# EasyEDA Pro project ProPrj_STC51_core.epro

# Schematic 51单片机核心板原理图
Assembly Variant: Basic; Board Name: Board1; Create Date: 2026-08-13; Page Name: P1; Project Name: STC51单片机核心板; Schematic Name: Schematic1; Update Date: 2026-08-13; Company: 山东科技大学信息工程2022级1班; Drawed: 姜运盛; Page Size: A4; Part Number: 内部图纸; Reviewed: 姜运盛; Version: V3.1
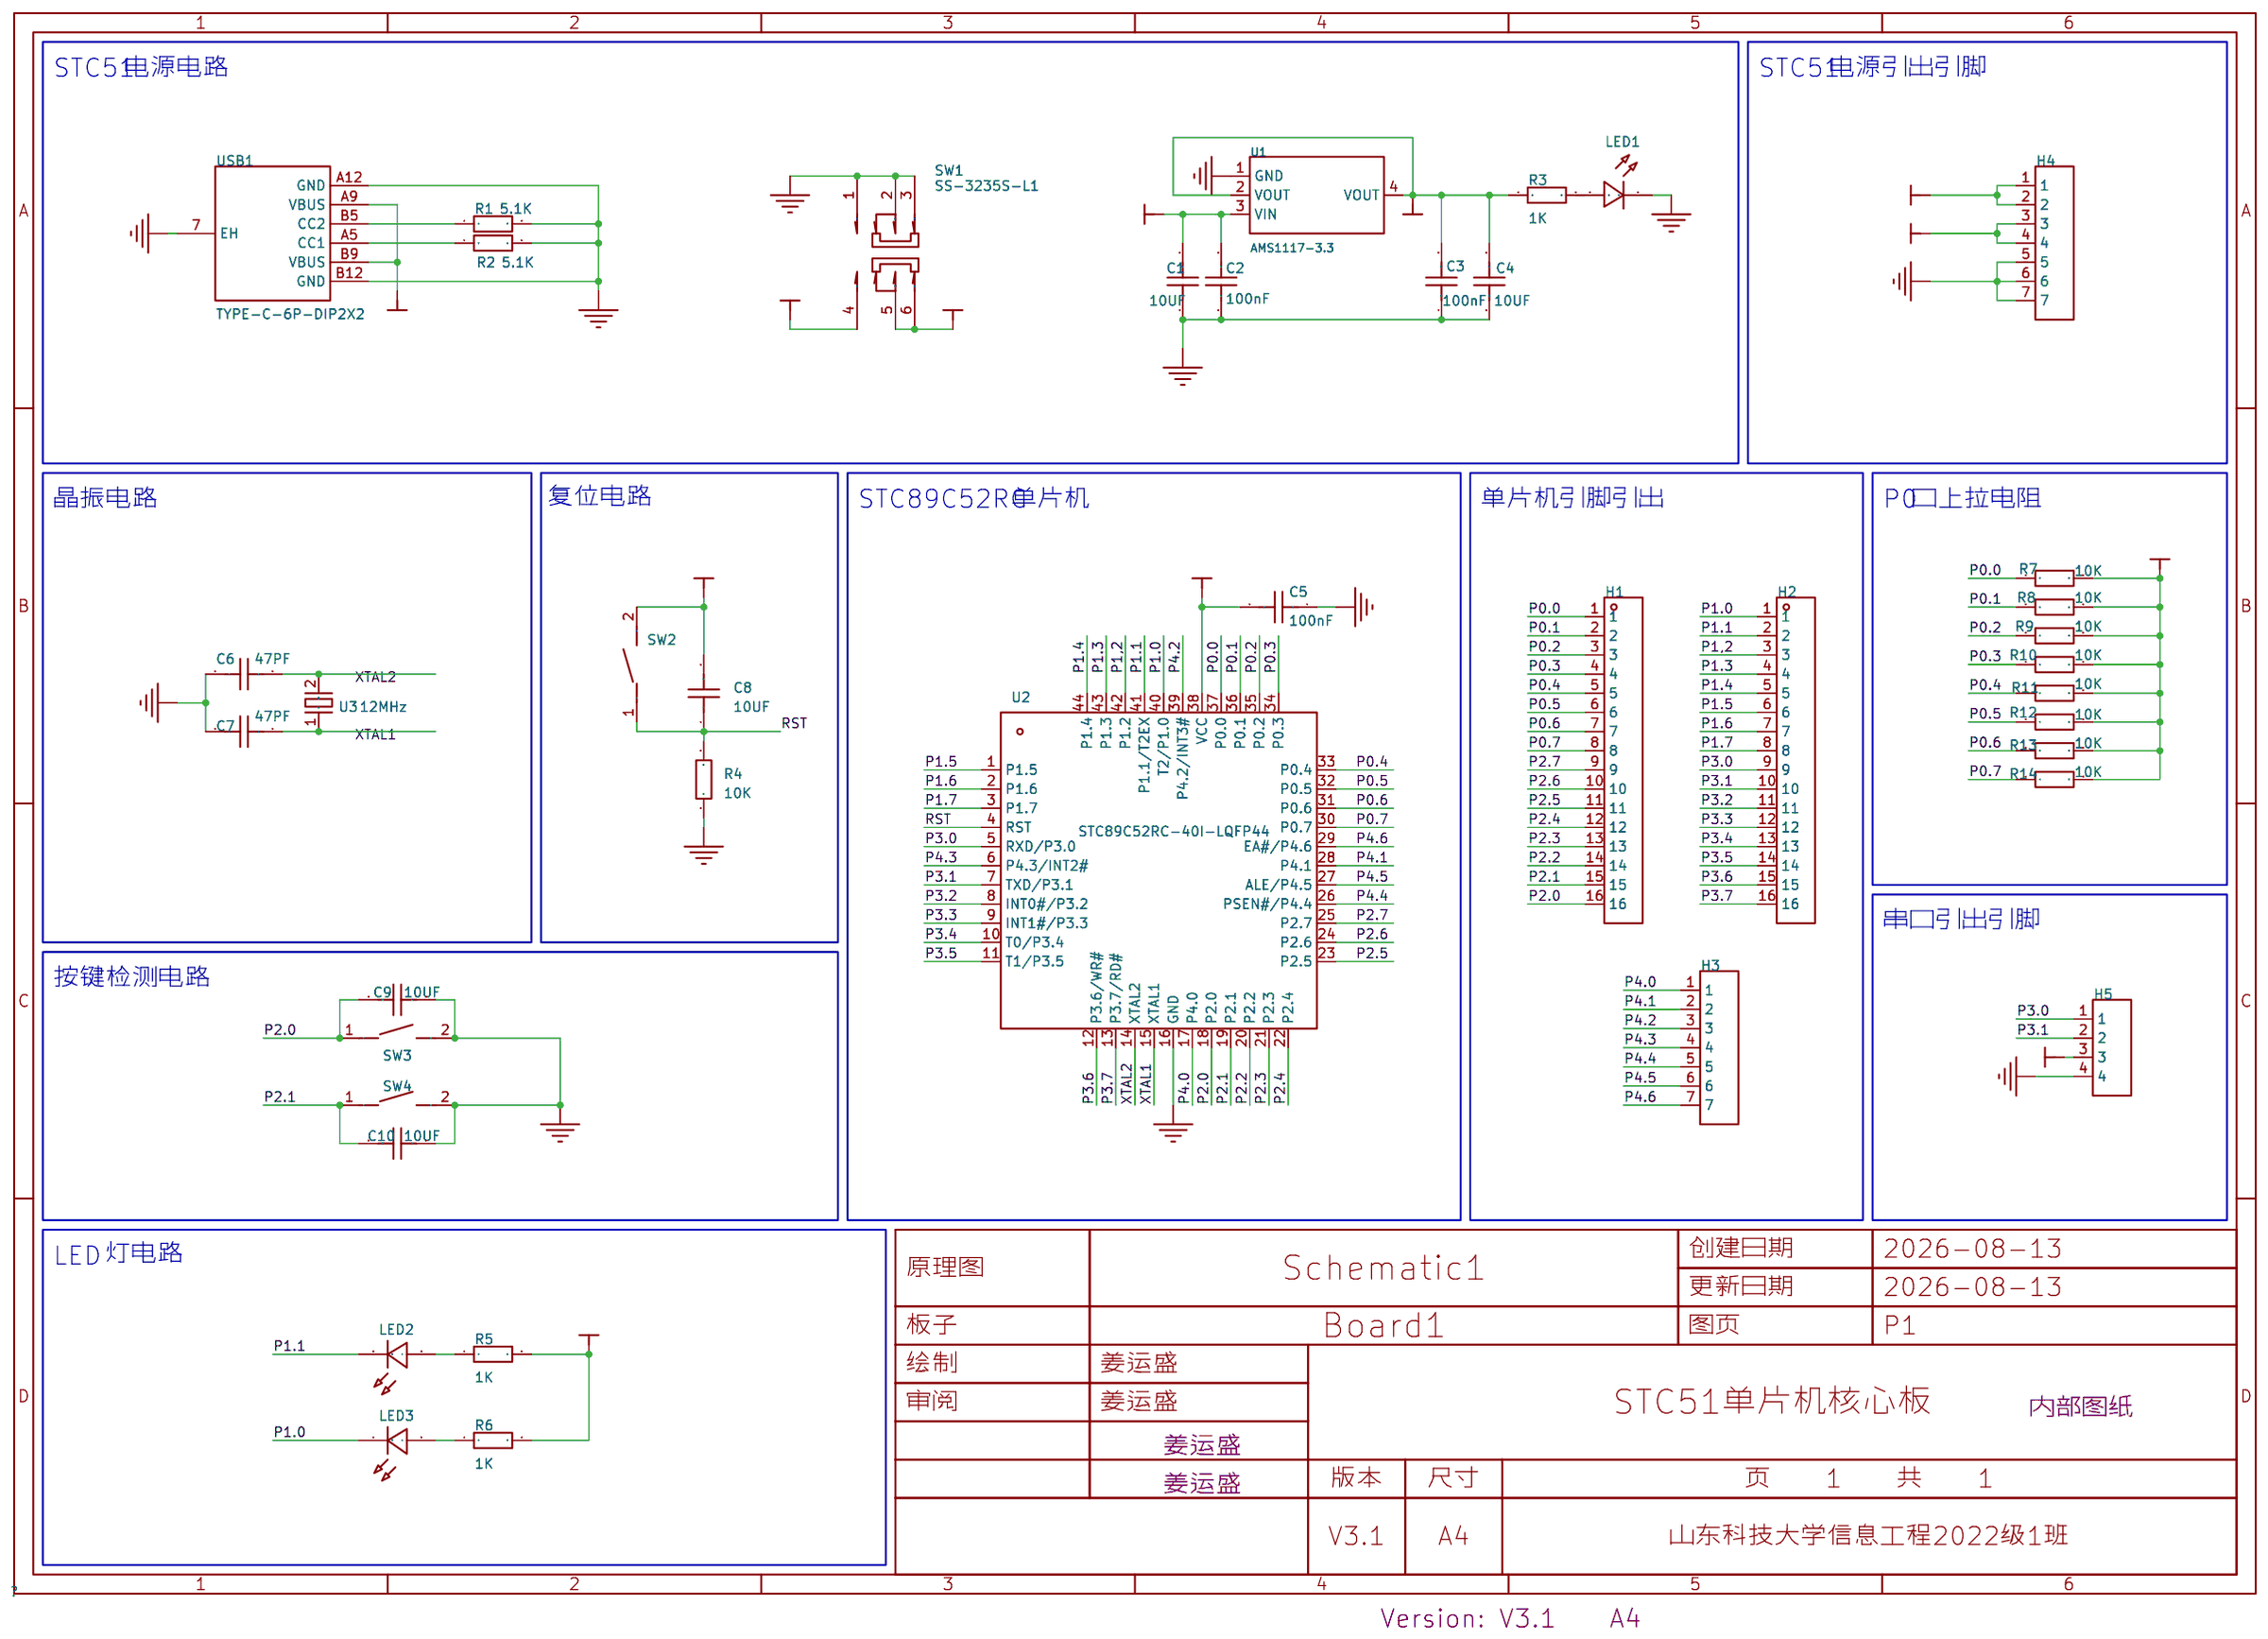
[diagram p0: schematic sheet]

## Parts
C1  10UF  [C0805]
C2  100nF  [C0805]
C3  100nF  [C0805]
C4  10UF  [C0805]
C5  100nF  [C0805]
C6  47PF  [C0805]
C7  47PF  [C0805]
C8  10UF  [C0805]
C9  10UF  [C0805]
C10  10UF  [C0805]
H1  -  [HDR-TH_16P-P2.54-V-M]
H2  -  [HDR-TH_16P-P2.54-V-M]
H3  -  [HDR-TH_7P-P2.54-V-M]
H4  -  [HDR-TH_7P-P2.54-V-M]
H5  -  [HDR-TH_4P-P2.54-V-M]
LED1  -  [LED_0805]
LED2  -  [LED_0805]
LED3  -  [LED_0805]
R1  5.1K  [R0805]
R2  5.1K  [R0805]
R3  1K  [R0805]
R4  10K  [R0805]
R5  1K  [R0805]
R6  1K  [R0805]
R7  10K  [R0805]
R8  10K  [R0805]
R9  10K  [R0805]
R10  10K  [R0805]
R11  10K  [R0805]
R12  10K  [R0805]
R13  10K  [R0805]
R14  10K  [R0805]
SW1  SS-3235S-L1  [SW-SMD_SS-3235S-LX]
SW2  轻触按键3*4*H  [SW-SMD_L4.0-W2.9-LS5.0]
SW3  轻触按键3*4*H  [SW-SMD_L4.0-W2.9-LS5.0]
SW4  轻触按键3*4*H  [SW-SMD_L4.0-W2.9-LS5.0]
U1  AMS1117-3.3  [SOT-223-3_L6.5-W3.4-P2.30-LS7.0-BR]
U2  STC89C52RC-40I-LQFP44  [LQFP-44_L10.0-W10.0-P0.80-LS12.0-BL]
U3  12MHz  [CRYSTAL-SMD_L11.4-W4.7-LS12.7]
USB1  TYPE-C-6P-DIP2X2  [TYPE-C-SMD_TYPE-C-6P]

## Library data of the parts
C1-C10 = CAP_0805: Supplier Footprint: 0805
H1 H2 = HDR-M_2.54_1x16P: 间距:2.54mm;总PIN位数:16;排数:1;插针结构:1x16P;行距:-;安装类型:直插;圆针/方针:方针;额定电流:3A;额定电压:-;配合针长度:6mm;塑高:2.5mm;端接针长度:3mm;触头材质:-;工作温度范围:-40℃~+105℃;颜色:黑色;; Supplier Part: C2894939; Supplier Footprint: 插件
H3 H4 = HDR-M_2.54_1x7P: Supplier Part: C492406; Supplier Footprint: 插件
H5 = HDR-M_2.54_1x4P: Supplier Part: C492403; Supplier Footprint: 插件
LED1-LED3 = LED_0805-G: Supplier Footprint: 0805
R1-R14 = Res_0805: Supplier Footprint: 0805
SW1 = SS-3235S-L1: 电路结构:双刀双掷;安装方式:卧贴;开关颜色:黑色;额定电流:50mA;额定电压:12V;工作寿命:1万次;; LCSC Part Name: 柄长2mm 卧贴双档 滑动开关; Supplier Part: C500055; Manufacturer: XKB Connection(中国星坤); Supplier Footprint: SMD,9.1x3.6mm; JLCPCB Part Class: Extended Part; Datasheet: https://item.szlcsc.com/datasheet/SS-3235S-L1/512181.html; Supplier: LCSC; Circuit: 双刀双掷; Actuator Style: 矩形柱状; Termination Style: 鸥翼型; Length: 9.1mm; Width: 3.55mm; Switch Height: 3.2mm; Mounting Type: 卧贴; Actuator Color: 黑色; Current Rating: 50mA; Voltage Rating: 12V; Life: 1万次; Operating Temperature: -40℃~+85℃
SW2-SW4 = 轻触按键3*4*H: Supplier Part: C9900017573; Supplier Footprint: 轻触按键3*4*2.5; JLCPCB Part Class: Extended Part; Supplier: LCSC
U1 = AMS1117-3.3_C6186: 输出极性:正极;工作电压:15V;输出电压:3.3V;输出电流:1A;电源纹波抑制比(PSRR):72dB@(120Hz);输出类型:固定;; LCSC Part Name: 3.3V 1A 15V; Supplier Part: C6186; Manufacturer: Advanced Monolithic Systems; Supplier Footprint: SOT-223; JLCPCB Part Class: Basic Part; Datasheet: https://item.szlcsc.com/datasheet/AMS1117-3.3/6652.html; Supplier: LCSC; Output Configuration: 正极; Voltage - Supply: 15V; Output Voltage: 3.3V; Output Current: 1A; Power Supply Rejection Ratio (PSRR): 72dB@(120Hz); Voltage Dropout: 1.1V@(800mA); standby current: 5mA; Noise: 0.003%Vout; Features: 短路保护；热关断；过流保护; Operating Temperature: -40℃~+125℃; Output Type: 固定; Number of Outputs: 1
U2 = STC89C52RC-40I-LQFP44: CPU内核:51家族;; LCSC Part Name: 单片机原理及应用; Supplier Part: C8707; Manufacturer: STC; Supplier Footprint: LQFP-44(10x10); JLCPCB Part Class: Extended Part; Datasheet: https://item.szlcsc.com/datasheet/STC89C52RC-40I-LQFP44/9213.html; Supplier: LCSC; CPU Core: 51家族; Program Storage Size: 8KB; Program Memory Type: FLASH; Number of I/O: 39; Voltage - Supply: 3.3V~5.5V
U3 = ABLS-12.000MHZ-B4H-T: 频率:12MHz;常温频差:±30ppm;负载电容:18pF;频率稳定度:±35ppm;; LCSC Part Name: 12MHz ±30ppm 18pF; Supplier Part: C1986452; Manufacturer: ABRACON; Supplier Footprint: HC-49S-SMD; JLCPCB Part Class: Extended Part; Datasheet: https://item.szlcsc.com/datasheet/ABLS-12.000MHZ-B4H-T/2077997.html; Supplier: LCSC; Normal temperature Frequency Tolerance: ±30ppm; Load Capacitance: 18pF; Frequency Stability: ±35ppm; Equivalent Series Resistance(ESR): 50Ω; Operating Temperature: -20℃~+70℃
USB1 = TYPE-C-6P-DIP2X2: Supplier Part: C9900017627; Supplier Footprint: TYPE-C-6P; JLCPCB Part Class: Extended Part; Supplier: LCSC

## Nets
3.3V: C3.2 C4.2 H4.3 H4.4 R3.1 R5.2 R6.2 U1.2(VOUT) U1.4(VOUT)
+5V: C1.2 C2.2 C5.2 C8.2 H4.1 H4.2 H5.3 R7.2 R8.2 R9.2 R10.2 R11.2 R12.2 R13.2 R14.2 SW1.5 SW1.6 SW2.2 U1.3(VIN) U2.38(VCC)
GND: C1.1 C2.1 C3.1 C4.1 C5.1 C6.1 C7.1 C9.1 C10.1 H4.5 H4.6 H4.7 H5.4 LED1.1(C) R1.2 R2.2 R4.1 SW1.1 SW1.2 SW1.3 SW3.2 SW4.2 U1.1(GND) U2.16(GND) USB1.7(EH) USB1.A12(GND) USB1.B12(GND)
VCC+5V: SW1.4 USB1.A9(VBUS) USB1.B9(VBUS)
P0.0: H1.1 R7.1 U2.37(P0.0)
P0.1: H1.2 R8.1 U2.36(P0.1)
P0.2: H1.3 R9.1 U2.35(P0.2)
P0.3: H1.4 R10.1 U2.34(P0.3)
P0.4: H1.5 R11.1 U2.33(P0.4)
P0.5: H1.6 R12.1 U2.32(P0.5)
P0.6: H1.7 R13.1 U2.31(P0.6)
P0.7: H1.8 R14.1 U2.30(P0.7)
P1,2: H2.3 U2.42(P1.2)
P1.0: H2.1 LED3.1(C) U2.40(T2/P1.0)
P1.1: H2.2 LED2.1(C) U2.41(P1.1/T2EX)
P1.3: H2.4 U2.43(P1.3)
P1.4: H2.5 U2.44(P1.4)
P1.5: H2.6 U2.1(P1.5)
P1.6: H2.7 U2.2(P1.6)
P1.7: H2.8 U2.3(P1.7)
P2.0: C9.2 H1.16 SW3.1 U2.18(P2.0)
P2.1: C10.2 H1.15 SW4.1 U2.19(P2.1)
P2.2: H1.14 U2.20(P2.2)
P2.3: H1.13 U2.21(P2.3)
P2.4: H1.12 U2.22(P2.4)
P2.5: H1.11 U2.23(P2.5)
P2.6: H1.10 U2.24(P2.6)
P2.7: H1.9 U2.25(P2.7)
P3.0: H2.9 H5.1 U2.5(RXD/P3.0)
P3.1: H2.10 H5.2 U2.7(TXD/P3.1)
P3.2: H2.11 U2.8(INT0#/P3.2)
P3.3: H2.12 U2.9(INT1#/P3.3)
P3.4: H2.13 U2.10(T0/P3.4)
P3.5: H2.14 U2.11(T1/P3.5)
P3.6: H2.15 U2.12(P3.6/WR#)
P3.7: H2.16 U2.13(P3.7/RD#)
P4.0: H3.1 U2.17(P4.0)
P4.1: H3.2 U2.28(P4.1)
P4.2: H3.3 U2.39(P4.2/INT3#)
P4.3: H3.4 U2.6(P4.3/INT2#)
P4.4: H3.5 U2.26(PSEN#/P4.4)
P4.5: H3.6 U2.27(ALE/P4.5)
P4.6: H3.7 U2.29(EA#/P4.6)
RST: C8.1 R4.2 SW2.1 U2.4(RST)
XTAL1: C7.2 U2.15(XTAL1) U3.1
XTAL2: C6.2 U2.14(XTAL2) U3.2(GND)
$1N1: R1.1 USB1.B5(CC2)
$1N3: R2.1 USB1.A5(CC1)
$1N13: LED1.2(A) R3.2
$1N179: LED2.2(A) R5.1
$1N180: LED3.2(A) R6.1

## Notes on the sheet
- STC51
- 电源电路
- STC51
- 电源引出引脚
- 晶振电路
- 复位电路
- STC89C52RC
- 单片机
- 单片机引脚引出
- P0
- 口上拉电阻
- 串口引出引脚
- 按键检测电路
- LED
- 灯电路

# Board 51单片机核心板PCB
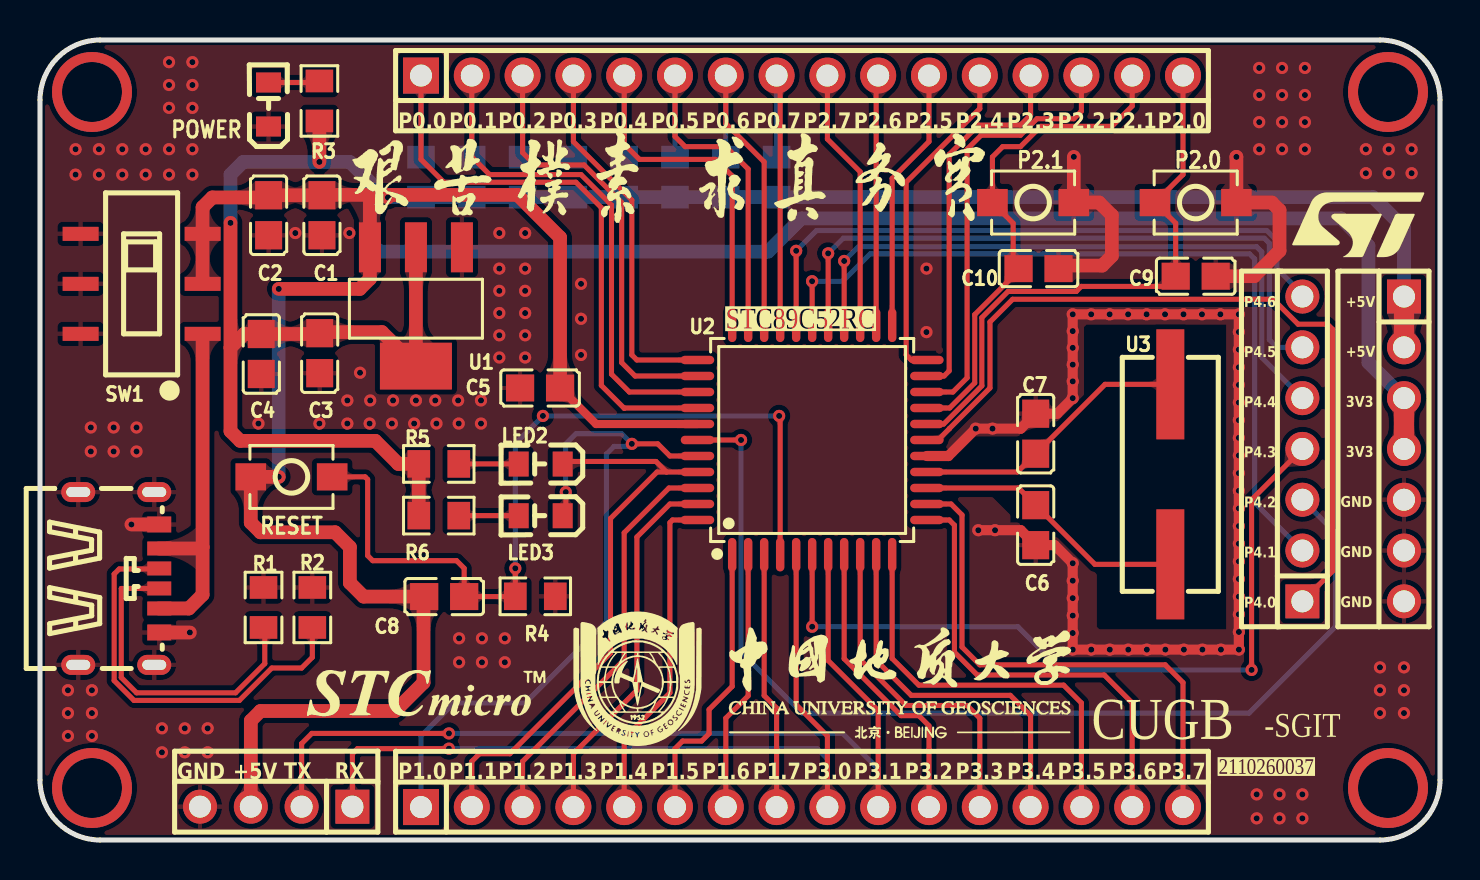
[diagram p1: board, top side]
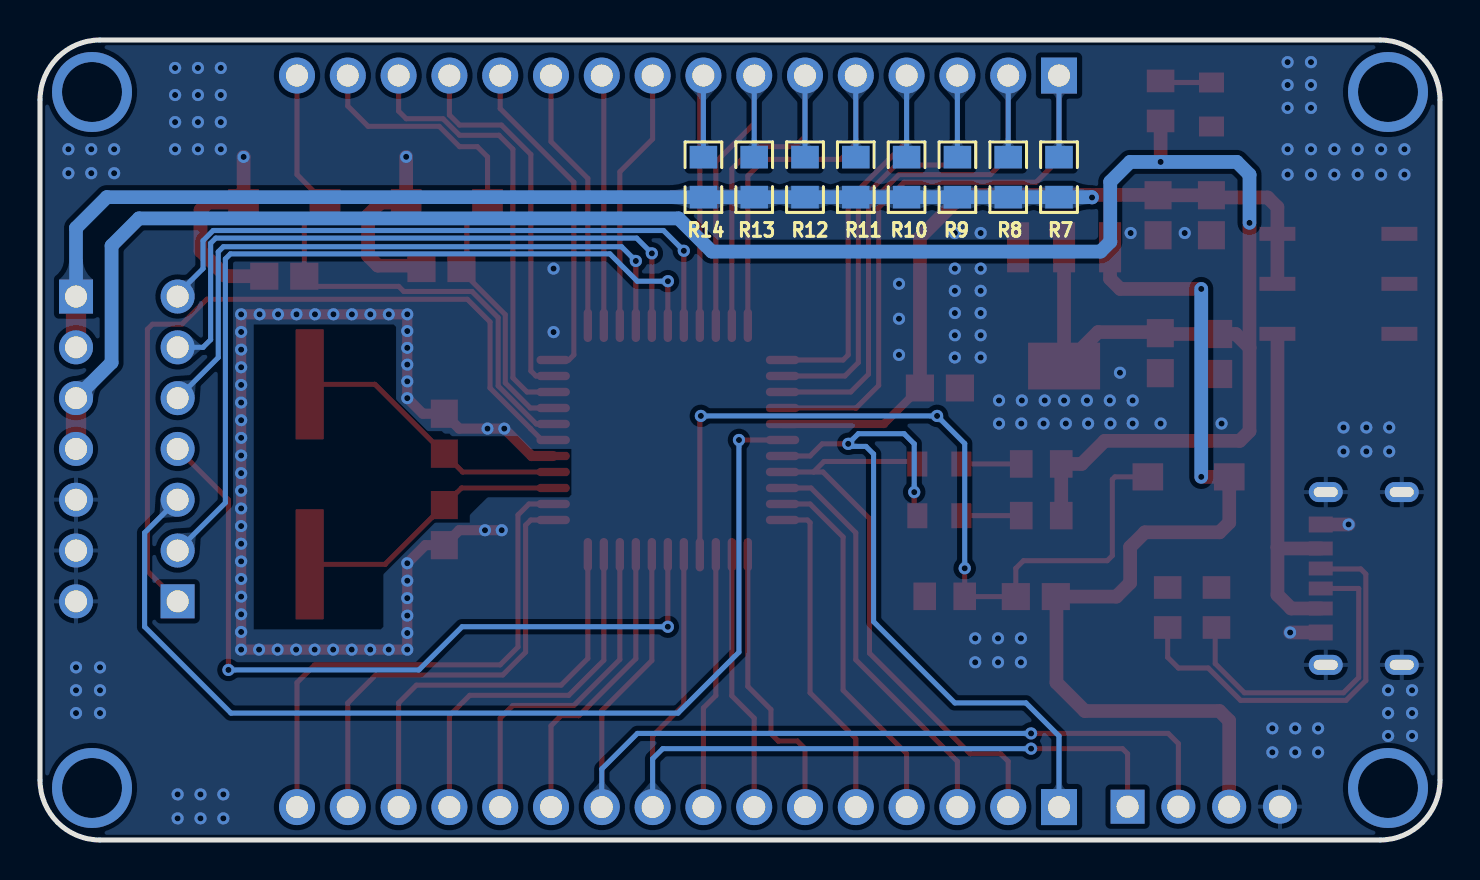
[diagram p2: board, bottom side, seen from below]

Outline 70 x 40 mm; copper layers: Top Layer, Bottom Layer. Coordinates in mm from the lower left corner of the outline.
Outline path: 0,37 0,3 arc(0.88,0.88) 3,0 67,0 arc(69.12,0.88) 70,3 70,37 arc(69.12,39.12) 67,40 3,40 arc(0.88,39.12) 0,37
Stack: Top Layer 0.035mm / Dielectric1 1.51mm FR4 er 4.5 / Bottom Layer 0.035mm

## Design rules (mm)
net XTAL2: DP1
net XTAL1: DP1
spacing copperThickness1oz (default): track to track 0.102, other pairs 0.152 to 0.3
spacing copperThickness2oz: track to track 0.203, other pairs 0.152 to 0.3
track width copperThickness1oz (default): min 0.127, default 0.254, max 2.54
track width copperThickness2oz: min 0.203, default 0.254, max 2.54
differential pair differentialPair (default): width min 0.127, default 0.254, max 2.54; gap min 0.152, default 0.152
net GND uses copperRegion

## Placement (name value [footprint] x y rotation side)
C1  10UF  [C0805]  14.1 31.24 90 top
C2  100nF  [C0805]  11.43 31.24 90 top
C3  100nF  [C0805]  13.98 24.34 90 top
C4  10UF  [C0805]  11.06 24.3 90 top
C5  100nF  [C0805]  25 22.6 0 top
C6  47PF  [C0805]  49.78 15.74 90 top
C7  47PF  [C0805]  49.78 20.31 270 top
C8  10UF  [C0805]  20.21 12.17 180 top
C9  10UF  [C0805]  57.78 28.19 180 top
C10  10UF  [C0805]  49.93 28.57 180 top
H1  -  [HDR-TH_16P-P2.54-V-M]  38.1 38.22 0 top
H2  -  [HDR-TH_16P-P2.54-V-M]  38.1 1.65 0 top
H3  -  [HDR-TH_7P-P2.54-V-M]  63.12 19.55 90 top
H4  -  [HDR-TH_7P-P2.54-V-M]  68.2 19.55 270 top
H5  -  [HDR-TH_4P-P2.54-V-M]  11.81 1.67 180 top
LED1  -  [LED_0805]  11.43 36.83 90 top
LED2  -  [LED_0805]  24.98 18.8 180 top
LED3  -  [LED_0805]  24.98 16.22 180 top
R1  5.1K  [R0805]  11.18 11.63 90 top
R2  5.1K  [R0805]  13.62 11.63 90 top
R3  1K  [R0805]  13.97 36.95 90 top
R4  10K  [R0805]  24.76 12.18 180 top
R5  1K  [R0805]  19.94 18.8 180 top
R6  1K  [R0805]  19.94 16.22 180 top
R7  10K  [R0805]  19.05 33.14 270 bottom
R8  10K  [R0805]  21.59 33.14 270 bottom
R9  10K  [R0805]  24.13 33.14 270 bottom
R10  10K  [R0805]  26.67 33.14 270 bottom
R11  10K  [R0805]  29.21 33.14 270 bottom
R12  10K  [R0805]  31.75 33.14 270 bottom
R13  10K  [R0805]  34.29 33.14 270 bottom
R14  10K  [R0805]  36.83 33.14 270 bottom
SW1  SS-3235S-L1  [SW-SMD_SS-3235S-LX]  5.08 27.81 90 top
SW2  轻触按键3*4*H  [SW-SMD_L4.0-W2.9-LS5.0]  12.57 18.16 180 top
SW3  轻触按键3*4*H  [SW-SMD_L4.0-W2.9-LS5.0]  57.78 31.87 0 top
SW4  轻触按键3*4*H  [SW-SMD_L4.0-W2.9-LS5.0]  49.66 31.87 0 top
U1  AMS1117-3.3  [SOT-223-3_L6.5-W3.4-P2.30-LS7.0-BR]  18.8 26.67 90 top
U2  STC89C52RC-40I-LQFP44  [LQFP-44_L10.0-W10.0-P0.80-LS12.0-BL]  38.61 20 0 top
U3  12MHz  [CRYSTAL-SMD_L11.4-W4.7-LS12.7]  56.51 18.28 270 top
USB1  TYPE-C-6P-DIP2X2  [TYPE-C-SMD_TYPE-C-6P]  3.94 13.08 270 top

## Footprints (pads in the part's own frame, mm; a bottom-side part is the same pattern mirrored in y, then rotated)
C0805
  rect 1.41x1.35 smd: 1(-1,0) 2(1,0)
CRYSTAL-SMD_L11.4-W4.7-LS12.7
  rect 5.5x1.4 smd: 1(-4.5,0) 2(4.5,0)
HDR-TH_4P-P2.54-V-M
  rect 1.7x1.7 hole 1.1: 1(-3.81,0)
  round 1.7 hole 1.1: 2(-1.27,0) 3(1.27,0) 4(3.81,0)
HDR-TH_7P-P2.54-V-M
  rect 1.7x1.7 hole 1.1: 1(-7.62,0)
  round 1.7 hole 1.1: 2(-5.08,0) 3(-2.54,0) 4(0,0) 5(2.54,0) 6(5.08,0) 7(7.62,0)
HDR-TH_16P-P2.54-V-M
  rect 1.8x1.8 hole 1.1: 1(-19.05,0)
  round 1.8 hole 1.1: 2(-16.51,0) 3(-13.97,0) 4(-11.43,0) 5(-8.89,0) 6(-6.35,0) 7(-3.81,0) 8(-1.27,0) 9(1.27,0) 10(3.81,0) 11(6.35,0) 12(8.89,0) 13(11.43,0) 14(13.97,0) 15(16.51,0) 16(19.05,0)
LED_0805
  rect 1x1.25 smd: 1(-1.15,0.005) 2(1.05,0.005)
LQFP-44_L10.0-W10.0-P0.80-LS12.0-BL
  oval 0.42x1.67 smd: 1(-4,-5.735) 2(-3.2,-5.735) 3(-2.4,-5.735) 4(-1.6,-5.735) 5(-0.8,-5.735) 6(0,-5.735) 7(0.8,-5.735) 8(1.6,-5.735) 9(2.4,-5.735) 10(3.2,-5.735) 11(4,-5.735) 23(4,5.735) 24(3.2,5.735) 25(2.4,5.735) 26(1.6,5.735) 27(0.8,5.735) 28(0,5.735) 29(-0.8,5.735) 30(-1.6,5.735) 31(-2.4,5.735) 32(-3.2,5.735) 33(-4,5.735)
  oval 1.67x0.42 smd: 12(5.735,-4) 13(5.735,-3.2) 14(5.735,-2.4) 15(5.735,-1.6) 16(5.735,-0.8) 17(5.735,0) 18(5.735,0.8) 19(5.735,1.6) 20(5.735,2.4) 21(5.735,3.2) 22(5.735,4) 34(-5.735,4) 35(-5.735,3.2) 36(-5.735,2.4) 37(-5.735,1.6) 38(-5.735,0.8) 39(-5.735,0) 40(-5.735,-0.8) 41(-5.735,-1.6) 42(-5.735,-2.4) 43(-5.735,-3.2) 44(-5.735,-4)
R0805
  rect 1.133x1.377 smd: 1(-1,0) 2(1,0)
SOT-223-3_L6.5-W3.4-P2.30-LS7.0-BR
  rect 2.5x1.1 smd: 1(2.97,-2.3) 2(2.97,0) 3(2.97,2.3)
  rect 2.34x3.6 smd: 4(-2.97,0)
SW-SMD_L4.0-W2.9-LS5.0
  rect 1.53x1.36 smd: 1(-2.035,0) 2(2.035,0)
SW-SMD_SS-3235S-LX
  rect 0.7x1.8 smd: 1(-2.5,3.05) 2(0,3.05) 3(2.5,3.05) 4(-2.5,-3.05) 5(0,-3.05) 6(2.5,-3.05)
TYPE-C-SMD_TYPE-C-6P
  oval 1x1.7 hole 0.5x1.2: 7(-4.32,1.775) 7(-4.32,-2.025) 7(4.32,1.775) 7(4.32,-2.025)
  rect 0.7x1.2 smd: A5(-0.5,2.025) A9(1.5,2.025) B5(0.5,2.025) B9(-1.5,2.025)
  rect 0.8x1.2 smd: A12(2.7,2.025) B12(-2.7,2.025)

## Nets
As in the schematic.

## Via types
v1: diameter 4, hole 3, Top Layer to Bottom Layer, 4 vias
v2: diameter 0.61, hole 0.305, Top Layer to Bottom Layer, 183 vias

## Routing (per net, layer and track width the routed paths; a pad name or vN(x,y) marks a point on that pad's centre or on a via; arc(x,y) is an arc through that point)
3.3V: length 116.7
  Top Layer w0.686: 9.53,24.61 10.21,25.3 C4.2 13.94,25.3 C3.2 14.04,25.39 17.1,25.39 U1.4 U1.2 ; 9.53,24.61 v2(9.53,30.86) ; 9.53,24.61 9.53,20.44 10.01,19.96 16.76,19.96 17.92,18.8 R5.2 R6.2 ; v2(13.97,33.9) R3.1
  Top Layer w1.016: H4.3 H4.4
  Bottom Layer w0.686: v2(9.53,30.86) 9.53,33.27 10.16,33.9 v2(13.97,33.9) 15.49,33.9 16.49,32.91 16.49,29.91 16.97,29.42 36.41,29.42 38.07,31.08 65.05,31.08 66.42,29.71 66.42,23.87 H4.3
+5V: length 146.7
  Top Layer w0.406: C5.2 27.8,20.8 U2.38
  Top Layer w0.686: 16.48,32.25 16.5,32.23 U1.3 16.5,28.06 15.99,27.55 v2(11.94,27.55) ; 16.48,32.25 14.11,32.25 C1.2 C2.2 11.32,32.13 8.61,32.13 8.13,31.64 SW1.6 SW1.5 ; 16.48,32.25 17.27,32.25 ; 10.54,1.67 10.54,5.96 11.03,6.45 17.76,6.45 19.18,7.87 19.18,12.14 C8.2 16.18,12.17 15.49,12.86 15.49,14.65 14.75,15.39 11.02,15.39 10.54,15.87 SW2.2 v2(11.94,18.16) ; C5.2 26,30.13 23.88,32.25 17.53,32.25 v2(17.4,32.13)
  Top Layer w1.016: H4.1 H4.2
  Bottom Layer w0.686: v2(17.4,32.13) 17.42,32.14 R7.2 R8.2 R9.2 R10.2 R11.2 R12.2 R13.2 R14.2 66.66,32.14 68.2,30.6 H4.1 ; v2(11.94,18.16) v2(11.94,27.55)
GND: length 78.5
  Top Layer w0.508: v2(46.91,15.49) v2(47.75,15.49) 49.04,15.49 C6.1 50.73,14.74 v2(51.64,13.84) v2(51.64,12.97) v2(51.64,12.09) v2(51.64,11.22) v2(51.64,10.35) v2(51.64,9.52) v2(52.56,9.52) v2(53.49,9.52) v2(54.42,9.52) v2(55.34,9.52) v2(56.27,9.52) v2(57.19,9.52) v2(58.12,9.52) v2(59.05,9.52) v2(59.94,9.52) v2(59.94,10.4) v2(59.94,11.28) v2(59.94,12.17) v2(59.94,13.05) v2(59.94,13.93) v2(59.94,14.81) v2(59.94,15.7) v2(59.94,16.58) v2(59.94,17.46) v2(59.94,18.34) v2(59.94,19.23) v2(59.94,20.11) v2(59.94,20.99) v2(59.94,21.87) v2(59.94,22.75) v2(59.94,23.64) v2(59.94,24.52) v2(59.94,25.4) v2(59.94,26.28) v2(59.02,26.28) v2(58.1,26.28) v2(57.18,26.28) v2(56.25,26.28) v2(55.33,26.28) v2(54.41,26.28) v2(53.48,26.28) v2(52.56,26.28) v2(51.64,26.28) v2(51.64,25.45) v2(51.64,24.61) v2(51.64,23.77) v2(51.64,22.93) v2(51.64,22.09) 50.86,21.31 C7.1 49.04,20.57 v2(47.62,20.57) v2(46.79,20.57) 45.42,19.2 U2.16
  Top Layer w0.686: C9.1 60.71,28.19 61.98,29.46 61.98,31.49 61.59,31.87 SW3.2 v2(59.82,34.16) 59.82,34.16 ; USB1.B12 v2(4.57,15.78) ; C10.1 51.08,28.72 53.11,28.72 53.59,29.2 53.59,31.24 52.96,31.87 SW4.2 v2(51.69,34.16) ; USB1.A12 v2(7.49,10.38)
  vias: v2(1.4,7.49) v2(1.4,6.34) v2(1.4,5.2) v2(1.78,34.54) v2(1.78,33.27) v2(2.54,20.63) v2(2.54,19.43) v2(2.6,7.49) v2(2.6,6.34) v2(2.6,5.2) v2(2.95,34.54) v2(2.95,33.27) v2(3.68,20.63) v2(3.68,19.43) v2(4.11,34.54) v2(4.11,33.27) v2(4.83,20.63) v2(4.83,19.43) v2(5.28,34.54) v2(5.28,33.27) v2(6.1,5.58) v2(6.1,4.38) v2(6.45,38.89) v2(6.45,37.75) v2(6.45,36.61) v2(6.45,34.54) v2(6.45,33.27) v2(7.24,5.58) v2(7.24,4.38) v2(7.62,38.89) v2(7.62,37.75) v2(7.62,36.61) v2(7.62,34.54) v2(7.62,33.27) v2(8.38,5.58) v2(8.38,4.38) v2(10.92,20.82) v2(12.77,30.35) v2(13.97,20.82) v2(15.37,21.98) v2(15.37,20.82) v2(15.47,30.35) v2(16,23.36) v2(16.51,21.98) v2(16.48,20.82) v2(17.59,20.82) v2(17.65,21.98) v2(18.71,20.82) v2(18.8,21.98) v2(19.76,21.98) v2(19.82,20.82) v2(20.91,21.98) v2(20.94,20.82) v2(20.96,10.08) v2(20.96,8.89) v2(22.05,21.98) v2(22.05,20.82) v2(22.1,10.08) v2(22.1,8.89) v2(22.97,30.35) v2(22.97,28.57) v2(22.97,27.46) v2(22.97,26.35) v2(22.97,25.24) v2(22.97,24.12) v2(23.24,10.08) v2(23.24,8.89) v2(24.26,30.35) v2(24.26,28.57) v2(24.26,27.46) v2(24.26,26.35) v2(24.26,25.24) v2(24.26,24.12) v2(27.05,27.81) v2(27.05,26.06) v2(27.05,24.25) v2(44.32,28.57) v2(44.32,25.39) v2(60.83,2.28) v2(60.83,1.08) v2(60.96,38.6) v2(60.96,37.25) v2(60.96,35.89) v2(60.96,34.54) v2(61.98,2.28) v2(61.98,1.08) v2(62.1,38.6) v2(62.1,37.25) v2(62.1,35.89) v2(62.1,34.54) v2(63.12,2.28) v2(63.12,1.08) v2(63.25,38.6) v2(63.25,37.25) v2(63.25,35.89) v2(63.25,34.54) v2(66.29,34.54) v2(66.29,33.34) v2(67,8.63) v2(67,7.49) v2(67,6.34) v2(67.44,34.54) v2(67.44,33.34) v2(68.2,8.63) v2(68.2,7.49) v2(68.2,6.34) v2(68.58,34.54) v2(68.58,33.34)
VCC+5V: length 17.7
  Top Layer w0.686: 8.13,14.64 8.13,12.26 7.44,11.58 USB1.A9 ; 8.13,14.64 8.06,14.58 USB1.B9 ; 8.13,14.64 8.13,25.31 SW1.4
(no net):
  vias: v1(2.6,37.4) v1(2.6,2.6) v1(67.4,37.4) v1(67.4,2.6)
P0.0: length 32.5
  Top Layer w0.254: U2.37 29.22,21.6 29.21,21.58 28.07,22.73 28.07,31.62 26.8,32.89 20.19,32.89 19.05,34.03 H1.1
  Bottom Layer w0.254: H1.1 R7.1
P0.1: length 29.3
  Top Layer w0.254: U2.36 29.46,22.4 28.57,23.29 28.57,31.75 27.05,33.27 22.48,33.27 21.59,34.16 H1.2
  Bottom Layer w0.254: H1.2 R8.1
P0.2: length 26
  Top Layer w0.254: H1.3 24.13,34.37 24.75,33.75 27.2,33.75 29.08,31.87 29.08,23.87 29.75,23.2 U2.35
  Bottom Layer w0.254: H1.3 R9.1
P0.3: length 22.6
  Top Layer w0.254: H1.4 26.67,34.92 29.59,31.99 29.59,24.25 29.84,24 U2.34
  Bottom Layer w0.254: H1.4 R10.1
P0.4: length 21
  Top Layer w0.254: U2.33 34.61,33.2 33.78,34.03 29.97,34.03 29.21,34.79 H1.5
  Bottom Layer w0.254: H1.5 R11.1
P0.5: length 19.3
  Top Layer w0.254: H1.6 31.75,35.17 32.26,34.67 34.29,34.67 35.41,33.55 U2.32
  Bottom Layer w0.254: H1.6 R12.1
P0.6: length 17.4
  Top Layer w0.254: U2.31 36.21,33.9 34.29,35.82 H1.7
  Bottom Layer w0.254: H1.7 R13.1
P0.7: length 16.6
  Top Layer w0.254: U2.30 37.01,38.04 H1.8
  Bottom Layer w0.254: H1.8 R14.1
P1,2: length 20.4
  Top Layer w0.254: H2.3 24.13,3.93 29.21,9.01 29.21,15.36 31.45,17.6 U2.42
P1.0: length 36
  Top Layer w0.254: 26.13,16.21 26.29,16.37 v2(26.29,17.39) ; v2(29.59,19.81) 30.89,19.81 31.5,19.2 U2.40
  Bottom Layer w0.254: v2(26.29,17.39) 26.29,19.81 26.8,20.31 29.08,20.31 v2(29.59,19.81) 29.46,19.68 28.7,19.68 28.32,19.3 28.32,10.92 24.26,6.85 20.7,6.85 19.05,5.2 H2.1
P1.1: length 28.5
  Top Layer w0.254: U2.41 31.32,18.4 ; 31.32,18.4 30.8,18.93 26.52,18.93 ; 31.32,18.4 30.85,18.4 28.53,16.07 28.53,9.34 23.5,4.31 21.97,4.31 21.59,3.93 H2.2
P1.3: length 18.5
  Top Layer w0.254: H2.4 26.67,4.31 29.84,7.49 29.84,15.15 31.5,16.8 U2.43
P1.4: length 16.6
  Top Layer w0.254: U2.44 31.63,16 31.5,15.87 31.5,7.36 29.21,5.08 H2.5
P1.5: length 14.4
  Top Layer w0.254: U2.1 34.61,7.68 33.45,6.52 33.45,5.32 33.08,4.95 32.13,4.95 31.75,4.57 H2.6
P1.6: length 13.1
  Top Layer w0.254: U2.2 35.41,7.21 34.29,6.09 H2.7
P1.7: length 12.9
  Top Layer w0.254: H2.8 36.83,6.6 36.21,7.22 U2.3
P2.0: length 28.5
  Top Layer w0.254: U2.18 45.18,20.8 47.09,22.71 47.09,26.12 48.4,27.43 51.81,27.43 52.07,27.68 56.28,27.68 C9.2 56.78,30.84 SW3.1 57.15,33.27 H1.16
P2.1: length 25
  Top Layer w0.254: U2.19 45.48,21.6 46.74,22.86 46.74,26.27 48.66,28.19 48.66,30.84 SW4.1 47.62,34.16 48.13,34.67 49.02,34.67 50.04,35.68 53.59,35.68 54.61,36.7 H1.15
P2.2: length 22
  Top Layer w0.254: H1.14 52.07,36.44 51.69,36.06 49.85,36.06 49.02,35.24 47.05,35.24 46.35,34.54 46.35,23.11 45.65,22.4 U2.20
P2.3: length 18.9
  Top Layer w0.254: U2.21 45.2,23.2 45.46,23.45 45.46,34.28 46.93,35.75 49.02,35.75 49.53,36.25 H1.13
P2.4: length 16.6
  Top Layer w0.254: H1.12 46.99,36.57 43.31,32.89 43.31,24.25 43.56,24 U2.22
P2.5: length 13.2
  Top Layer w0.254: U2.23 42.61,33.08 44.45,34.92 H1.11
P2.6: length 12.5
  Top Layer w0.254: U2.24 41.81,38.12 H1.10
P2.7: length 13.2
  Top Layer w0.254: H1.9 39.37,35.05 41.01,33.41 U2.25
P3.0: length 42.4
  Top Layer w0.254: H2.9 39.37,5.2 37.81,6.76 U2.5 ; 15.62,1.67 15.62,4.31 15.88,4.57 v2(20.45,4.57)
  Bottom Layer w0.254: H2.9 39.37,4.06 38.86,4.57 v2(20.45,4.57)
P3.1: length 48.5
  Top Layer w0.254: v2(20.45,5.33) 13.59,5.33 13.08,4.82 H5.2 ; U2.7 39.41,8.97 41.91,6.47 H2.10
  Bottom Layer w0.254: H2.10 41.91,3.55 40.13,5.33 v2(20.45,5.33)
P3.2: length 14.9
  Top Layer w0.254: H2.11 44.45,5.71 43.94,6.22 43.05,6.22 40.21,9.06 U2.8
P3.3: length 16.9
  Top Layer w0.254: H2.12 46.99,6.09 46.35,6.73 43.31,6.73 41.01,9.03 U2.9
P3.4: length 18.7
  Top Layer w0.254: U2.10 41.81,8.99 43.56,7.23 48.51,7.23 49.53,6.22 H2.13
P3.5: length 20.8
  Top Layer w0.254: H2.14 52.07,6.85 51.18,7.74 43.94,7.74 42.61,9.08 U2.11
P3.6: length 23
  Top Layer w0.254: H2.15 54.61,6.85 53.21,8.25 46.86,8.25 45.72,9.39 45.72,15.74 45.46,16 U2.12
P3.7: length 26.6
  Top Layer w0.254: H2.16 57.15,7.87 56.26,8.76 46.99,8.76 46.1,9.65 46.1,16.25 45.55,16.8 U2.13
P4.0: length 40
  Top Layer w0.254: U2.17 44.91,20 45.46,20.56 45.46,20.57 47.5,22.6 47.5,25.9 48.63,27.04 61.66,27.04 62.91,25.79 64.38,25.79 64.63,25.54 64.63,13.44 H3.1
P4.1: length 40.6
  Top Layer w0.254: v2(38.6,27.94) 38.61,27.94 U2.28
  Bottom Layer w0.254: v2(38.6,27.94) 40.14,27.94 41.5,29.31 60.48,29.31 60.73,29.05 60.73,16.86 H3.2
P4.2: length 52.6
  Top Layer w0.254: U2.39 v2(35.05,20)
  Bottom Layer w0.254: v2(35.05,20) 35.05,9.39 38.1,6.34 60.45,6.34 64.77,10.66 64.77,15.36 H3.3
P4.3: length 38.6
  Top Layer w0.254: U2.6 v2(38.61,10.66) ; H3.4 60.58,17.01 v2(60.58,8.5)
  Bottom Layer w0.254: v2(60.58,8.5) 51.05,8.5 48.9,10.66 v2(38.61,10.66)
P4.4: length 32.7
  Top Layer w0.254: U2.26 v2(40.21,28.95)
  Bottom Layer w0.254: v2(40.21,28.95) 40.92,29.66 60.83,29.66 61.09,29.41 61.09,24.12 H3.5
P4.5: length 32.7
  Top Layer w0.254: U2.27 v2(39.41,29.33)
  Bottom Layer w0.254: v2(39.41,29.33) 40.17,30.09 61.21,30.09 61.47,29.84 61.47,25.01 61.85,24.63 H3.6
P4.6: length 31.8
  Top Layer w0.254: U2.29 v2(37.81,29.46)
  Bottom Layer w0.254: 63.25,27.17 61.85,28.57 61.85,29.97 61.34,30.47 38.82,30.47 v2(37.81,29.46)
RST: length 43.1
  Top Layer w0.254: SW2.1 16.26,18.16 16.38,18.03 16.38,14.22 16.64,13.97 20.83,13.97 21.21,13.58 C8.1 23.75,12.17 R4.2 v2(23.76,13.58) ; U2.4 37.01,21.15 v2(36.96,21.2)
  Bottom Layer w0.254: v2(36.96,21.2) v2(25.15,21.2) 23.76,19.82 v2(23.76,13.58)
XTAL1: length 14
  Top Layer w0.254: U3.1 53.25,22.78 C7.2 48.87,18.4 U2.15
XTAL2: length 13.8
  Top Layer w0.254: U3.2 52.74,13.78 C6.2 48.93,17.6 U2.14
$1N1: length 16.3
  Top Layer w0.254: R1.1 11.24,10.56 11.24,8.82 9.78,7.36 4.83,7.36 4.06,8.12 4.06,12.57 4.07,12.58 USB1.B5
$1N3: length 20.4
  Top Layer w0.254: R2.1 13.62,9.14 13.08,8.6 11.59,8.6 9.97,6.98 4.7,6.98 3.71,7.97 3.71,13.3 3.96,13.55 5.85,13.55 USB1.A5
$1N13: length 2.6
  Top Layer w0.254: 11.42,37.88 13.89,37.88 R3.2
$1N179: length 3
  Top Layer w0.254: R5.1 23.93,18.8 LED2.2
$1N180: length 3
  Top Layer w0.254: R6.1 23.93,16.22 23.93,16.21

## Copper pours and planes (outline as drawn; the poured copper is in the pictures)
GND on Top Layer: -2.29,42.03 71.63,42.03 71.63,-0.89 -2.29,-0.89
GND on Top Layer: -1.14,41.78 71.75,41.78 71.75,-1.02 -1.14,-1.02
GND on Bottom Layer: -1.4,41.14 71.37,41.14 71.37,-0.64 -1.4,-0.64

Small or netless copper shapes (teardrops, artwork), in the pictures only: 172 on Top Layer, 58 on Bottom Layer

## Text on the board
Top Silkscreen Layer: POWER | RESET | P2.1 | P2.0 | P4.6 | P4.5 | P4.4 | P4.3 | P4.2 | P4.1 | P4.0 | GND | +5V | 3V3 | TX | RX | P0.0 | P1.0 | P0.1 | P1.1 | P0.2 | P1.2 | P0.3 | P1.3 | P0.4 | P1.4 | P0.5 | P1.5 | P0.6 | P1.6 | P0.7 | P1.7 | P2.7 | P3.0 | P2.6 | P3.1 | P2.5 | P3.2 | P2.4 | P3.3 | P2.3 | P3.4 | P2.2 | P3.5 | P3.6 | P3.7 | 2110260037 | STC89C52RC | -SGIT | CUGB
